# Altium schematic sheet TELEX_CORE_LEFT_V2.0.SchDoc
size A3; SheetNumber: 1; SheetTotal: 1
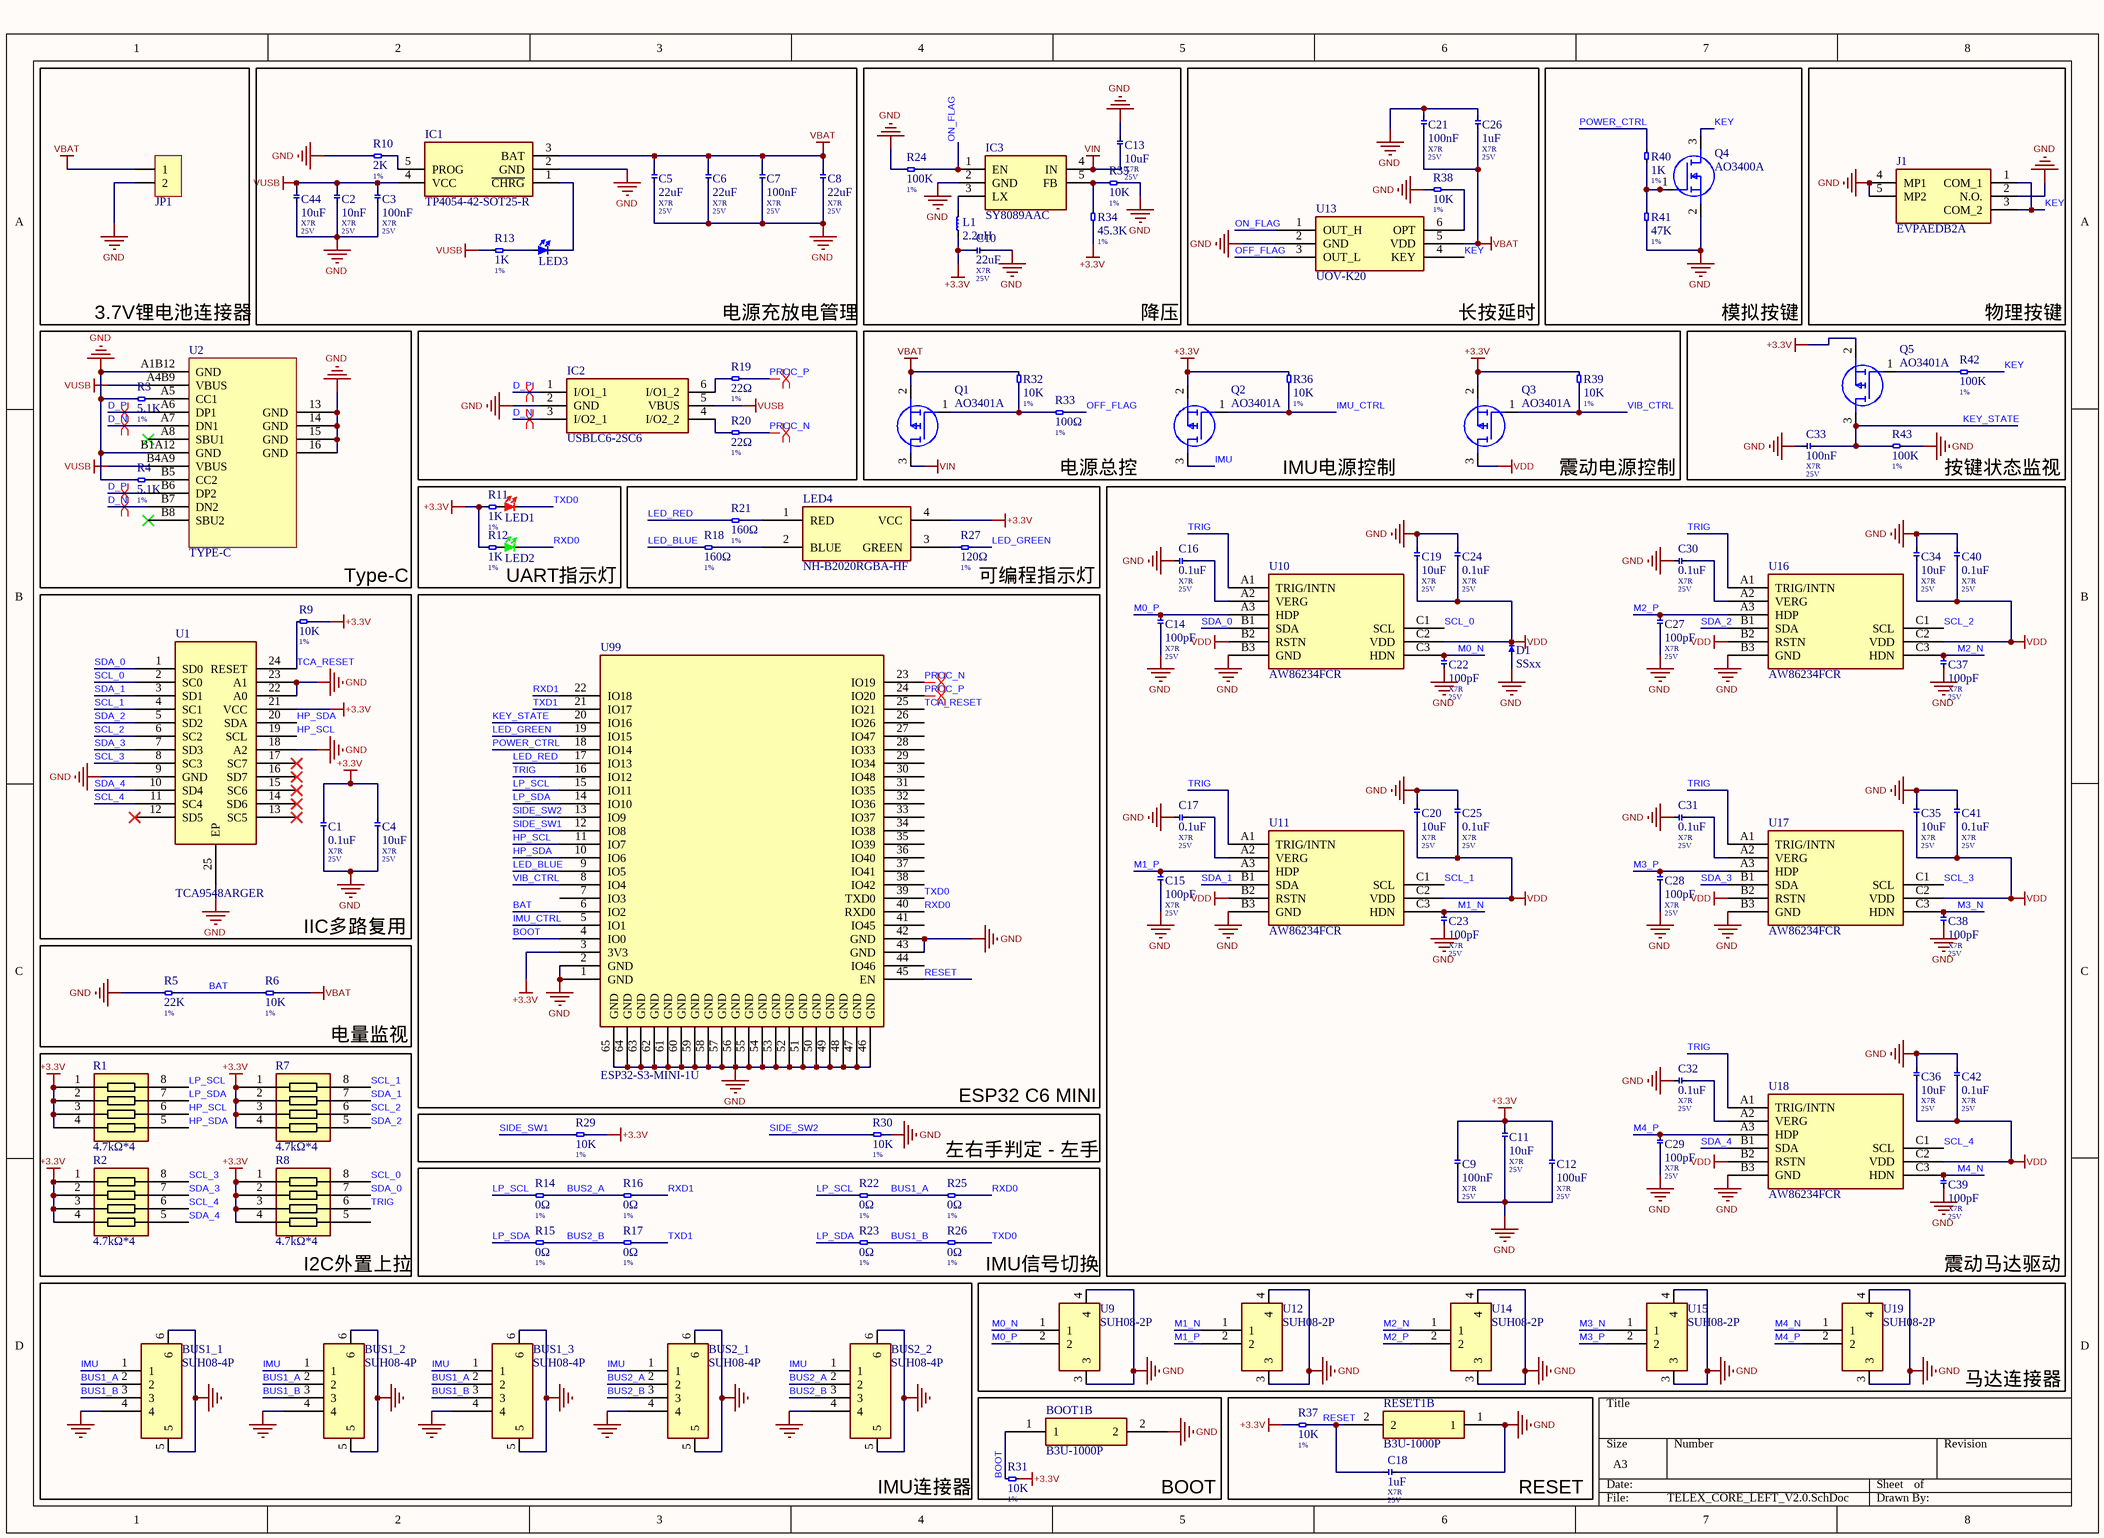
[diagram p0: TELEX_CORE_LEFT_V2.0.SchDoc]

## Parts
BOOT1  B3U-1000P  [B3U-1000P]  (part B of 2)
BUS1_1  SUH08-4P  [WAFER-SUH08-WT-4A-4P-P0.80]
BUS1_2  SUH08-4P  [WAFER-SUH08-WT-4A-4P-P0.80]
BUS1_3  SUH08-4P  [WAFER-SUH08-WT-4A-4P-P0.80]
BUS2_1  SUH08-4P  [WAFER-SUH08-WT-4A-4P-P0.80]
BUS2_2  SUH08-4P  [WAFER-SUH08-WT-4A-4P-P0.80]
C1  0.1uF  材质: X7R  耐压: 25V  [C0603]
C2  10nF  材质: X7R  耐压: 25V  [C0603]
C3  100nF  材质: X7R  耐压: 25V  [C0603]
C4  10uF  材质: X7R  耐压: 25V  [C0603]
C5  22uF  材质: X7R  耐压: 25V  [C0603]
C6  22uF  材质: X7R  耐压: 25V  [C0603]
C7  100nF  材质: X7R  耐压: 25V  [C0603]
C8  22uF  材质: X7R  耐压: 25V  [C0603]
C9  100nF  材质: X7R  耐压: 25V  [C0603]
C10  22uF  材质: X7R  耐压: 25V  [C0603]
C11  10uF  材质: X7R  耐压: 25V  [C0603]
C12  100uF  材质: X7R  耐压: 25V  [C1206]
C13  10uF  材质: X7R  耐压: 25V  [C0603]
C14  100pF  材质: X7R  耐压: 25V  [C0603]
C15  100pF  材质: X7R  耐压: 25V  [C0603]
C16  0.1uF  材质: X7R  耐压: 25V  [C0603]
C17  0.1uF  材质: X7R  耐压: 25V  [C0603]
C18  1uF  材质: X7R  耐压: 25V  [C0603]
C19  10uF  材质: X7R  耐压: 25V  [C0603]
C20  10uF  材质: X7R  耐压: 25V  [C0603]
C21  100nF  材质: X7R  耐压: 25V  [C0603]
C22  100pF  材质: X7R  耐压: 25V  [C0603]
C23  100pF  材质: X7R  耐压: 25V  [C0603]
C24  0.1uF  材质: X7R  耐压: 25V  [C0603]
C25  0.1uF  材质: X7R  耐压: 25V  [C0603]
C26  1uF  材质: X7R  耐压: 25V  [C0603]
C27  100pF  材质: X7R  耐压: 25V  [C0603]
C28  100pF  材质: X7R  耐压: 25V  [C0603]
C29  100pF  材质: X7R  耐压: 25V  [C0603]
C30  0.1uF  材质: X7R  耐压: 25V  [C0603]
C31  0.1uF  材质: X7R  耐压: 25V  [C0603]
C32  0.1uF  材质: X7R  耐压: 25V  [C0603]
C33  100nF  材质: X7R  耐压: 25V  [C0603]
C34  10uF  材质: X7R  耐压: 25V  [C0603]
C35  10uF  材质: X7R  耐压: 25V  [C0603]
C36  10uF  材质: X7R  耐压: 25V  [C0603]
C37  100pF  材质: X7R  耐压: 25V  [C0603]
C38  100pF  材质: X7R  耐压: 25V  [C0603]
C39  100pF  材质: X7R  耐压: 25V  [C0603]
C40  0.1uF  材质: X7R  耐压: 25V  [C0603]
C41  0.1uF  材质: X7R  耐压: 25V  [C0603]
C42  0.1uF  材质: X7R  耐压: 25V  [C0603]
C44  10uF  材质: X7R  耐压: 25V  [C0603]
D1  SSxx  [SOD-123FL]
IC1  TP4054-42-SOT25-R  [SOT95P280X100-5N]
IC2  USBLC6-2SC6  [SOT95P280X145-6N]
IC3  SY8089AAC  [SOT95P285X140-5N]
J1  EVPAEDB2A  [EVPAEJB2A]
JP1  HDR-1X2  [ZH1.5-WS-2P]  (value not drawn)
L1  2.2uH  [L3030]
LED1  LED_RED  [LED0603_RED]  (value not drawn)
LED2  LED_GREEN  [LED0603_GREEN]  (value not drawn)
LED3  LED_BLUE  [LED0603_BLUE]  (value not drawn)
LED4  NH-B2020RGBA-HF  [NH-B2020RGBA-HF]
Q1  AO3401A  [SOT95P280X125-3N]
Q2  AO3401A  [SOT95P280X125-3N]
Q3  AO3401A  [SOT95P280X125-3N]
Q4  AO3400A  [SOT95P280X125-3N]
Q5  AO3401A  [SOT95P280X125-3N]
R1  4.7kΩ*4  [0603*4]
R2  4.7kΩ*4  [0603*4]
R3  5.1K  精度: 1%  [R0603]
R4  5.1K  精度: 1%  [R0603]
R5  22K  精度: 1%  [R0603]
R6  10K  精度: 1%  [R0603]
R7  4.7kΩ*4  [0603*4]
R8  4.7kΩ*4  [0603*4]
R9  10K  精度: 1%  [R0603]
R10  2K  精度: 1%  [R0603]
R11  1K  精度: 1%  [R0603]
R12  1K  精度: 1%  [R0603]
R13  1K  精度: 1%  [R0603]
R14  0Ω  精度: 1%  [R0603]
R15  0Ω  精度: 1%  [R0603]
R16  0Ω  精度: 1%  [R0603]
R17  0Ω  精度: 1%  [R0603]
R18  160Ω  精度: 1%  [R0603]
R19  22Ω  精度: 1%  [R0603]
R20  22Ω  精度: 1%  [R0603]
R21  160Ω  精度: 1%  [R0603]
R22  0Ω  精度: 1%  [R0603]
R23  0Ω  精度: 1%  [R0603]
R24  100K  精度: 1%  [R0603]
R25  0Ω  精度: 1%  [R0603]
R26  0Ω  精度: 1%  [R0603]
R27  120Ω  精度: 1%  [R0603]
R29  10K  精度: 1%  [R0603]
R30  10K  精度: 1%  [R0603]
R31  10K  精度: 1%  [R0603]
R32  10K  精度: 1%  [R0603]
R33  100Ω  精度: 1%  [R0603]
R34  45.3K  精度: 1%  [R0603]
R35  10K  精度: 1%  [R0603]
R36  10K  精度: 1%  [R0603]
R37  10K  精度: 1%  [R0603]
R38  10K  精度: 1%  [R0603]
R39  10K  精度: 1%  [R0603]
R40  1K  精度: 1%  [R0603]
R41  47K  精度: 1%  [R0603]
R42  100K  精度: 1%  [R0603]
R43  100K  精度: 1%  [R0603]
RESET1  B3U-1000P  [B3U-1000P]  (part B of 2)
U1  TCA9548ARGER  [TCA9548ARGER]
U2  TYPE-C  [TYPE-C-F]
U9  SUH08-2P  [WAFER-SUH08-WT-2A-2P-P0.80]
U10  AW86234FCR  [DSBGA-9_L1.4-W1.3-R3-C3-P0.40-BL]
U11  AW86234FCR  [DSBGA-9_L1.4-W1.3-R3-C3-P0.40-BL]
U12  SUH08-2P  [WAFER-SUH08-WT-2A-2P-P0.80]
U13  UOV-K20  [UOV-K20]
U14  SUH08-2P  [WAFER-SUH08-WT-2A-2P-P0.80]
U15  SUH08-2P  [WAFER-SUH08-WT-2A-2P-P0.80]
U16  AW86234FCR  [DSBGA-9_L1.4-W1.3-R3-C3-P0.40-BL]
U17  AW86234FCR  [DSBGA-9_L1.4-W1.3-R3-C3-P0.40-BL]
U18  AW86234FCR  [DSBGA-9_L1.4-W1.3-R3-C3-P0.40-BL]
U19  SUH08-2P  [WAFER-SUH08-WT-2A-2P-P0.80]
U99  ESP32-S3-MINI-1U  [ESP32-S3-MINI-1U]

## Blocks framed on the sheet
3.7V锂电池连接器: JP1
降压: C10 C13 IC3 L1 R24 R34 R35
长按延时: C21 C26 R38 U13
模拟按键: Q4 R40 R41
物理按键: J1
Type-C: R3 R4 U2
电源充放电管理: IC2 R19 R20
UART指示灯: LED1 LED2 R11 R12
IIC多路复用: C1 C4 R9 U1
BOOT: BOOT1 R31
RESET: C18 R37 RESET1

## Nets
+3.3V: C1.2 C4.2 C9.2 C10.2 C11.2 C12.2 L1.1 LED4.4(VCC) Q2.2(S) Q3.2(S) Q5.2(S) R1.1 R1.2 R1.3 R1.4 R2.1 R2.2 R2.3 R2.4 R7.1 R7.2 R7.3 R7.4 R8.1 R8.2 R8.3 R8.4 R9.2 R11.1 R12.1 R29.2 R31.1 R34.2 R36.1 R37.1 R39.1 U1.21(VCC) U99.3(3V3)
GND: BOOT1.2 BUS1_1.4 BUS1_1.5 BUS1_1.6 BUS1_2.4 BUS1_2.5 BUS1_2.6 BUS1_3.4 BUS1_3.5 BUS1_3.6 BUS2_1.4 BUS2_1.5 BUS2_1.6 BUS2_2.4 BUS2_2.5 BUS2_2.6 C1.1 C2.1 C3.1 C4.1 C5.1 C6.1 C7.1 C8.1 C9.1 C10.1 C11.1 C12.1 C13.2 C14.2 C15.2 C16.2 C17.2 C18.2 C19.1 C20.1 C21.1 C22.1 C23.1 C24.1 C25.1 C26.1 C27.2 C28.2 C29.2 C30.2 C31.2 C32.2 C33.1 C34.1 C35.1 C36.1 C37.1 C38.1 C39.1 C40.1 C41.1 C42.1 C44.1 D1.1(A) IC1.2(GND) IC2.2(GND) IC3.2(GND) J1.2(N.O.) J1.4(MP1) J1.5(MP2) JP1.2 Q4.2(S) R3.1 R4.1 R5.2 R10.1 R24.1 R30.2 R35.2 R38.1 R41.1 R43.1 RESET1.1 U1.9(GND) U1.18(A2) U1.22(A0) U1.23(A1) U1.25(EP) U2.13(GND) U2.14(GND) U2.15(GND) U2.16(GND) U2.A1B12(GND) U2.B1A12(GND) U9.3 U9.4 U10.B3(GND) U11.B3(GND) U12.3 U12.4 U13.2(GND) U14.3 U14.4 U15.3 U15.4 U16.B3(GND) U17.B3(GND) U18.B3(GND) U19.3 U19.4 U99.1(GND) U99.2(GND) U99.42(GND) U99.43(GND) U99.46(GND) U99.47(GND) U99.48(GND) U99.49(GND) U99.50(GND) U99.51(GND) U99.52(GND) U99.53(GND) U99.54(GND) U99.55(GND) U99.56(GND) U99.57(GND) U99.58(GND) U99.59(GND) U99.60(GND) U99.61(GND) U99.62(GND) U99.63(GND) U99.64(GND) U99.65(GND)
VBAT: C5.2 C6.2 C7.2 C8.2 C21.2 C26.2 IC1.3(BAT) JP1.1 Q1.2(S) R6.1 R32.1 U13.5(VDD)
VDD: C19.2 C20.2 C24.2 C25.2 C34.2 C35.2 C36.2 C40.2 C41.2 C42.2 D1.2(K) Q3.3(D) U10.B2(RSTN) U10.C2(VDD) U11.B2(RSTN) U11.C2(VDD) U16.B2(RSTN) U16.C2(VDD) U17.B2(RSTN) U17.C2(VDD) U18.B2(RSTN) U18.C2(VDD)
VIN: C13.1 IC3.4(IN) Q1.3(D)
VUSB: C2.2 C3.2 C44.2 IC1.4(VCC) IC2.5(VBUS) R13.1 U2.A4B9(VBUS) U2.B4A9(VBUS)
BAT: R5.1 R6.2 U99.6(IO2)
BOOT: BOOT1.1 R31.2 U99.4(IO0)
BUS1_A: BUS1_1.2 BUS1_2.2 BUS1_3.2 R22.2 R25.1
BUS1_B: BUS1_1.3 BUS1_2.3 BUS1_3.3 R23.2 R26.1
BUS2_A: BUS2_1.2 BUS2_2.2 R14.2 R16.1
BUS2_B: BUS2_1.3 BUS2_2.3 R15.2 R17.1
D_N: IC2.3(I/O2_1) U2.A7(DN1) U2.B7(DN2)
D_P: IC2.1(I/O1_1) U2.A6(DP1) U2.B6(DP2)
HP_SCL: R1.6 U1.19(SCL) U99.11(IO7)
HP_SDA: R1.5 U1.20(SDA) U99.10(IO6)
IMU: BUS1_1.1 BUS1_2.1 BUS1_3.1 BUS2_1.1 BUS2_2.1 Q2.3(D)
IMU_CTRL: Q2.1(G) R36.2 U99.5(IO1)
KEY: J1.1(COM_1) J1.3(COM_2) Q4.3(D) R42.1 U13.4(KEY)
KEY_STATE: C33.2 Q5.3(D) R43.2 U99.20(IO16)
LED_BLUE: R18.1 U99.9(IO5)
LED_GREEN: R27.2 U99.19(IO15)
LED_RED: R21.1 U99.17(IO13)
LP_SCL: R1.8 R14.1 R22.1 U99.15(IO11)
LP_SDA: R1.7 R15.1 R23.1 U99.14(IO10)
M0_N: C22.2 U9.1 U10.C3(HDN)
M0_P: C14.1 U9.2 U10.A3(HDP)
M1_N: C23.2 U11.C3(HDN) U12.1
M1_P: C15.1 U11.A3(HDP) U12.2
M2_N: C37.2 U14.1 U16.C3(HDN)
M2_P: C27.1 U14.2 U16.A3(HDP)
M3_N: C38.2 U15.1 U17.C3(HDN)
M3_P: C28.1 U15.2 U17.A3(HDP)
M4_N: C39.2 U18.C3(HDN) U19.1
M4_P: C29.1 U18.A3(HDP) U19.2
OFF_FLAG: R33.2 U13.3(OUT_L)
ON_FLAG: IC3.1(EN) R24.2 U13.1(OUT_H)
POWER_CTRL: R40.2 U99.18(IO14)
PROC_N: R20.1 U99.23(IO19)
PROC_P: R19.1 U99.24(IO20)
RESET: C18.1 R37.2 RESET1.2 U99.45(EN)
RXD0: LED2.2 R25.2 U99.40(RXD0)
RXD1: R16.2 U99.22(IO18)
SCL_0: R8.8 U1.2(SC0) U10.C1(SCL)
SCL_1: R7.8 U1.4(SC1) U11.C1(SCL)
SCL_2: R7.6 U1.6(SC2) U16.C1(SCL)
SCL_3: R2.8 U1.8(SC3) U17.C1(SCL)
SCL_4: R2.6 U1.11(SC4) U18.C1(SCL)
SDA_0: R8.7 U1.1(SD0) U10.B1(SDA)
SDA_1: R7.7 U1.3(SD1) U11.B1(SDA)
SDA_2: R7.5 U1.5(SD2) U16.B1(SDA)
SDA_3: R2.7 U1.7(SD3) U17.B1(SDA)
SDA_4: R2.5 U1.10(SD4) U18.B1(SDA)
SIDE_SW1: R29.1 U99.12(IO8)
SIDE_SW2: R30.1 U99.13(IO9)
TCA_RESET: R9.1 U1.24(RESET) U99.25(IO21)
TRIG: R8.6 U10.A1(TRIG/INTN) U11.A1(TRIG/INTN) U16.A1(TRIG/INTN) U17.A1(TRIG/INTN) U18.A1(TRIG/INTN) U99.16(IO12)
TXD0: LED1.2 R26.2 U99.39(TXD0)
TXD1: R17.2 U99.21(IO17)
VIB_CTRL: Q3.1(G) R39.2 U99.8(IO4)
NetC16_1: C16.1 U10.A2(VERG)
NetC17_1: C17.1 U11.A2(VERG)
NetC30_1: C30.1 U16.A2(VERG)
NetC31_1: C31.1 U17.A2(VERG)
NetC32_1: C32.1 U18.A2(VERG)
NetIC1_1: IC1.1(~{CHRG}) LED3.2
NetIC1_5: IC1.5(PROG) R10.2
NetIC2_4: IC2.4(I/O2_2) R20.2
NetIC2_6: IC2.6(I/O1_2) R19.2
NetIC3_3: IC3.3(LX) L1.2
NetIC3_5: IC3.5(FB) R34.1 R35.1
NetLED1_1: LED1.1 R11.2
NetLED2_1: LED2.1 R12.2
NetLED3_1: LED3.1 R13.2
NetLED4_1: LED4.1(RED) R21.2
NetLED4_2: LED4.2(BLUE) R18.2
NetLED4_3: LED4.3(GREEN) R27.1
NetQ1_1: Q1.1(G) R32.2 R33.1
NetQ4_1: Q4.1(G) R40.1 R41.2
NetQ5_1: Q5.1(G) R42.2
NetR3_2: R3.2 U2.A5(CC1)
NetR4_2: R4.2 U2.B5(CC2)
NetR38_2: R38.2 U13.6(OPT)

Not connected (* = marked no-connect by the designer): R8 5; U1 12(SD5)* 13(SC5)* 14(SD6)* 15(SC6)* 16(SD7)* 17(SC7)*; U2 A8(SBU1)* B8(SBU2)*; U99 7(IO3) 26(IO26) 27(IO47) 28(IO33) 29(IO34) 30(IO48) 31(IO35) 32(IO36) 33(IO37) 34(IO38) 35(IO39) 36(IO40) 37(IO41) 38(IO42) 41(IO45) 44(IO46)

## Layout directives
differential pair: D_N, D_P, PROC_N, PROC_P

## Notes on the sheet
- (near R33) 电源总控
- IMU电源控制
- 震动电源控制
- (near R43) 按键状态监视
- (near R27) 可编程指示灯
- (near R7) 电量监视
- (near R25) 左右手判定 - 左手
- ESP32 C6 MINI
- (near R8) I2C外置上拉
- IMU信号切换
- 震动马达驱动
- 马达连接器
- (near BUS2_2) IMU连接器

## Library data of the parts
C1-C42 C44 = CC: 瓷片电容; 精度: 20%; 品牌: muRata; 类别: 电容
D1 = SSxx: 肖特基二极管
IC1 = TP4054-42-SOT25-R: Integrated Circuit; Manufacturer_Name: TOP POWER; Datasheet Link: http://images.100y.com.tw/pdf_file/38-TP-TP4054x.pdf; Height: 1mm; Manufacturer_Part_Number: TP4054-42-SOT25-R
IC2 = USBLC6-2SC6: Integrated Circuit; Manufacturer_Name: STMicroelectronics; Datasheet Link: https://www.st.com/resource/en/datasheet/usblc6-2.pdf; Height: 1.45mm; Manufacturer_Part_Number: USBLC6-2SC6; Mouser Part Number: 511-USBLC6-2SC6; Mouser Price/Stock: https://www.mouser.co.uk/ProductDetail/STMicroelectronics/USBLC6-2SC6?qs=po45yt2pPpu%2FhNIlwQdTlg%3D%3D; Arrow Part Number: USBLC6-2SC6; Arrow Price/Stock: https://www.arrow.com/en/products/usblc6-2sc6/stmicroelectronics.html?utm_currency=USD&region=nac
IC3 = SY8089AAC: Integrated Circuit; Manufacturer_Name: Silergy; Datasheet Link: https://datasheet.lcsc.com/szlcsc/Silergy-Corp-SY8089AAAC_C78988.pdf; Height: 1.4mm; Manufacturer_Part_Number: SY8089AAC
J1 = EVPAEDB2A: Connector; Manufacturer_Name: Panasonic; Datasheet Link: https://industry.panasonic.com/ac/cdn/e/control/switch/light-touch/catalog/sw_lt_eng_4522s_side_eg.pdf; Height: 1.75mm; Manufacturer_Part_Number: EVPAEDB2A; Arrow Part Number: EVPAEDB2A; Arrow Price/Stock: https://www.arrow.com/en/products/evp-aedb2a/panasonic
JP1 = Header 2: 2P接插件; 版权归属: 源创客; BOM名称: 2P接插件; 学习资源: www.ooocke.com
L1 = LG: 功率电感; 精度: 20%; 高度: 2.0; 类别: 电感; 品牌: 顺络
LED1 = LED_RED: 发光二极管（红）
LED2 = LED_GREEN: 发光二极管（绿）
LED3 = LED_BLUE: 发光二极管（蓝）
LED4 = NH-B2020RGBA-HF: multiple-color LED
Q1-Q3 Q5 = AO3401A: MOSFET (P-Channel); Manufacturer_Name: Alpha & Omega Semiconductors; Datasheet Link: http://www.aosmd.com/pdfs/datasheet/AO3401A.pdf; Height: 1.25mm; Manufacturer_Part_Number: AO3401A; Arrow Part Number: AO3401A; Arrow Price/Stock: https://www.arrow.com/en/products/ao3401a/alpha-and-omega-semiconductor.html?utm_currency=USD&region=europe
Q4 = AO3400A: MOSFET (N-Channel); Manufacturer_Name: Alpha & Omega Semiconductors; Datasheet Link: http://aosmd.com/res/data_sheets/AO3400A.pdf; Height: 1.25mm; Manufacturer_Part_Number: AO3400A; Arrow Part Number: AO3400A; Arrow Price/Stock: https://www.arrow.com/en/products/ao3400a/alpha-and-omega-semiconductor?utm_currency=USD&region=nac
R3-R6 R9-R27 R29-R43 = R: 贴片电阻; 类别: 电阻; 品牌: 国巨; 材质: 薄膜